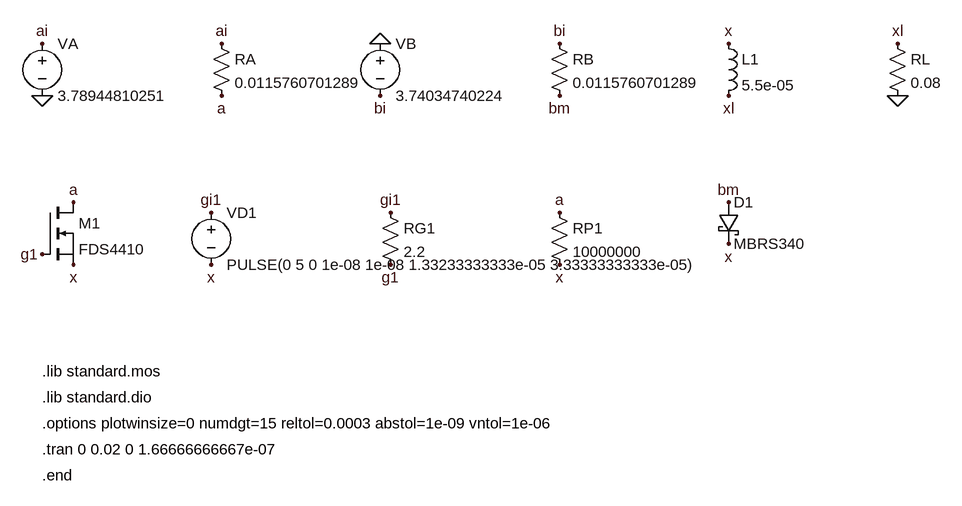
[diagram p0: schematic buck_boost_diode_real.asc]
buck_boost_diode_real.asc, the LTspice schematic file:
Version 4
SHEET 1 1880 1200
SYMBOL voltage 160 120 R0
SYMATTR InstName VA
SYMATTR Value 3.78944810251
FLAG 160 136 ai
FLAG 160 216 0
SYMBOL res 420 120 R0
SYMATTR InstName RA
SYMATTR Value 0.0115760701289
FLAG 436 136 ai
FLAG 436 216 a
SYMBOL voltage 680 120 R0
SYMATTR InstName VB
SYMATTR Value 3.74034740224
FLAG 680 136 0
FLAG 680 216 bi
SYMBOL res 940 120 R0
SYMATTR InstName RB
SYMATTR Value 0.0115760701289
FLAG 956 136 bi
FLAG 956 216 bm
SYMBOL ind 1200 120 R0
SYMATTR InstName L1
SYMATTR Value 5.5e-05
FLAG 1216 136 x
FLAG 1216 216 xl
SYMBOL res 1460 120 R0
SYMATTR InstName RL
SYMATTR Value 0.08
FLAG 1476 136 xl
FLAG 1476 216 0
SYMBOL nmos 160 380 R0
SYMATTR InstName M1
SYMATTR Value FDS4410
FLAG 208 380 a
FLAG 160 460 g1
FLAG 208 476 x
SYMBOL voltage 420 380 R0
SYMATTR InstName VD1
SYMATTR Value PULSE(0 5 0 1e-08 1e-08 1.33233333333e-05 3.33333333333e-05)
FLAG 420 396 gi1
FLAG 420 476 x
SYMBOL res 680 380 R0
SYMATTR InstName RG1
SYMATTR Value 2.2
FLAG 696 396 gi1
FLAG 696 476 g1
SYMBOL res 940 380 R0
SYMATTR InstName RP1
SYMATTR Value 10000000
FLAG 956 396 a
FLAG 956 476 x
SYMBOL schottky 1200 380 R0
SYMATTR InstName D1
SYMATTR Value MBRS340
FLAG 1216 380 bm
FLAG 1216 444 x
TEXT 160 640 Left 2 !.lib standard.mos
TEXT 160 680 Left 2 !.lib standard.dio
TEXT 160 720 Left 2 !.options plotwinsize=0 numdgt=15 reltol=0.0003 abstol=1e-09 vntol=1e-06
TEXT 160 760 Left 2 !.tran 0 0.02 0 1.66666666667e-07
TEXT 160 800 Left 2 !.end

The netlist it stands for:
* buck_boost_diode_real.asc
VA ai 0 3.78944810251
RA ai a 0.0115760701289
VB 0 bi 3.74034740224
RB bi bm 0.0115760701289
L1 x xl 5.5e-05
RL xl 0 0.08
M1 a g1 x x FDS4410
VD1 gi1 x PULSE(0 5 0 1e-08 1e-08 1.33233333333e-05 3.33333333333e-05)
RG1 gi1 g1 2.2
RP1 a x 10000000
D1 bm x MBRS340
.model D D
.lib standard.dio
.model NMOS NMOS
.model PMOS PMOS
.lib standard.mos
.lib standard.mos
.lib standard.dio
.options plotwinsize=0 numdgt=15 reltol=0.0003 abstol=1e-09 vntol=1e-06
.tran 0 0.02 0 1.66666666667e-07
.end
.backanno
.end